# Altium project Pukk-Sensor-Module-v1.0.PrjPcb (part 3 of 6)

## Sheet Controller-Sheet-1.SchDoc
size 420 x 297 mm; SheetNumber: 3; SheetTotal: 8
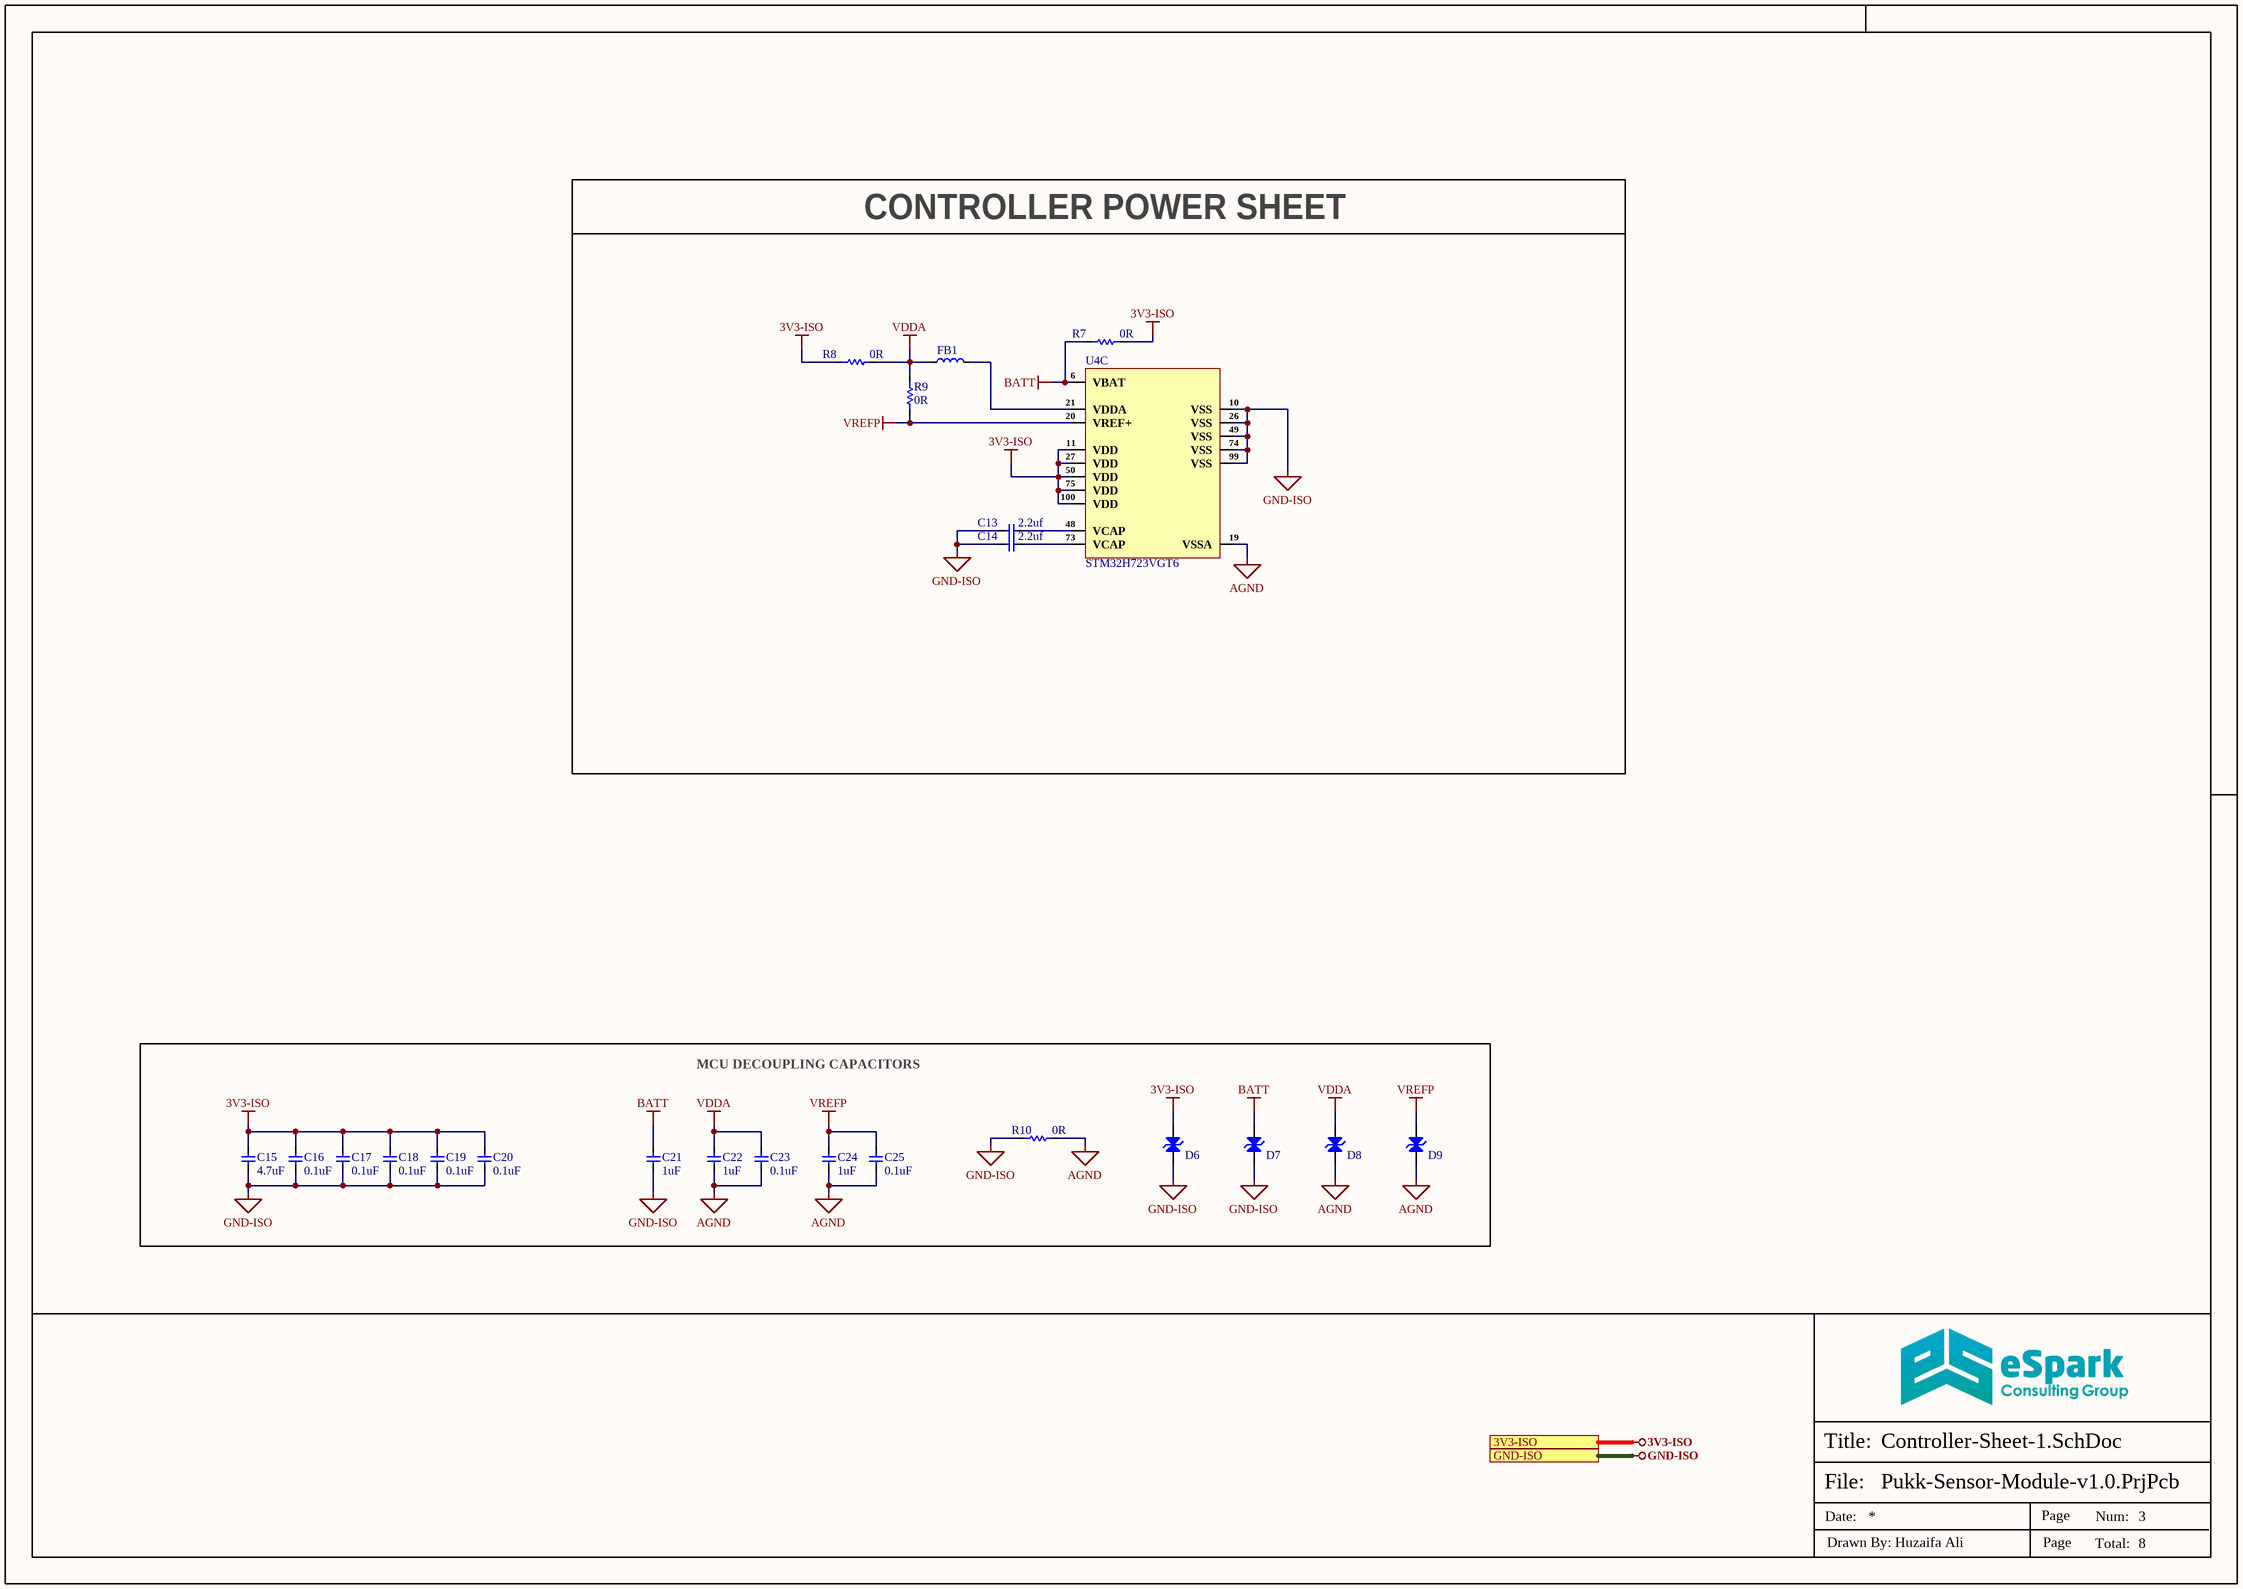
[diagram p2: Controller-Sheet-1.SchDoc]

### Parts
C13  2.2uf  [Cap-0402]
C14  2.2uf  [Cap-0402]
C15  4.7uF  [Cap-0402]
C16  0.1uF  [Cap-0402]
C17  0.1uF  [Cap-0402]
C18  0.1uF  [Cap-0402]
C19  0.1uF  [Cap-0402]
C20  0.1uF  [Cap-0402]
C21  1uF  [Cap-0402]
C22  1uF  [Cap-0402]
C23  0.1uF  [Cap-0402]
C24  1uF  [Cap-0402]
C25  0.1uF  [Cap-0402]
D6  ESDM2033MX4T5G  [DFN-2(0.3x0.6)]  (value not drawn)
D7  ESDM2033MX4T5G  [DFN-2(0.3x0.6)]  (value not drawn)
D8  ESDM2033MX4T5G  [DFN-2(0.3x0.6)]  (value not drawn)
D9  ESDM2033MX4T5G  [DFN-2(0.3x0.6)]  (value not drawn)
FB1  MMZ2012R102ATD25  [Ind-0805]  (value not drawn)
R7  0R  [Res-0402]
R8  0R  [Res-0402]
R9  0R  [Res-0402]
R10  0R  [Res-0402]
U4  STM32H723VGT6  [LQFP-100]  (part C of 3)

### Blocks framed on the sheet
CONTROLLER POWER SHEET: C13 C14 FB1 R7-R9 U4
MCU DECOUPLING CAPACITORS: C15-C25 D6-D9 R10

### Ports
3V3-ISO (see Top-Sheet[3A], CAN-Sheet[4D], Controller-Sheet-2[4D], Power-Sheet[4D], Sensors-Sheet[1D]), GND-ISO (see Top-Sheet[3A], CAN-Sheet[4D], Controller-Sheet-2[4D], Power-Sheet[4D], Sensors-Sheet[1D], USB-Sheet[4D])

### Nets
3V3-ISO: C15.2 C16.2 C17.2 C18.2 C19.2 C20.2 D6.2(A) R7.1 R8.2 U4.11(VDD) U4.27(VDD) U4.50(VDD) U4.75(VDD) U4.100(VDD) ; port 3V3-ISO
AGND: C22.1 C23.1 C24.1 C25.1 D8.1(A) D9.1(A) R10.2 U4.19(VSSA)
BATT: C21.2 D7.2(A) R7.2 U4.6(VBAT)
GND-ISO: C13.2 C14.2 C15.1 C16.1 C17.1 C18.1 C19.1 C20.1 C21.1 D6.1(A) D7.1(A) R10.1 U4.10(VSS) U4.26(VSS) U4.49(VSS) U4.74(VSS) U4.99(VSS) ; port GND-ISO
VDDA: C22.2 C23.2 D8.2(A) FB1.1 R8.1 R9.2
VREFP: C24.2 C25.2 D9.2(A) R9.1 U4.20(VREF+)
NetC13_1: C13.1 U4.48(VCAP)
NetC14_1: C14.1 U4.73(VCAP)
NetFB1_2: FB1.2 U4.21(VDDA)

### Notes on the sheet
- File:
- Title:
- Date:
- Page
- Num:
- Total:
- Drawn By: Huzaifa Ali

### Library data of the parts
C13 C14 = GRM155R61E225KE11D: CAP CER 2.2UF 25V X5R 0402; Manufacturer: Murata; Material: Ceramic; Tolerance: 10%; Item Type: Capacitor; Supplier 1: Avnet; Manufacturer Part Number: GRM155R61E225KE11D; RoHS: Yes; Category: Ceramic Capacitors; Stock 1: 210000; Pricing 1: 10000=0.03830, 20000=0.03623, 40000=0.03416, 60000=0.03209, 80000=0.03002, 100000=0.02795, 1000000=0.02588 (USD); Mount: Surface Mount; Case/Package: 0402; Case Code (Metric): 1005; Case Code (Imperial): 0402; Weight: 0.000212oz; Min Operating Temperature: -55°C; Max Operating Temperature: 85°C; Dielectric: X5R; Capacitance: 2.2uF; Packaging: Tape and Reel; Voltage Rating: 25V; Termination: SMD/SMT; Resistor Type: Ceramic; Voltage Rating (DC): 25V; Package Quantity: 10000; Length: 1mm; Width: 0.5mm; Height: 0.5mm; Thickness: 0.022inch; Lead Free: Lead Free; RoHS Compliant: Yes; ComponentLink1URL: http://www.mouser.com/ds/2/281/c02e-2905.pdf?src-supplier=Mouser; ComponentLink1Description: http://www.mouser.com/ds/2/281/c02e-2905.pdf?src-supplier=Mouser; ComponentLink2URL: http://search.murata.co.jp/Ceramy/image/img/A01X/G101/ENG/GRM155R61E225KE11-01.pdf?src-supplier=Digi-Key; ComponentLink2Description: http://search.murata.co.jp/Ceramy/image/img/A01X/G101/ENG/GRM155R61E225KE11-01.pdf?src-supplier=Digi-Key; ComponentLink3URL: http://search.murata.co.jp/Ceramy/image/img/A01X/partnumbering_e_01.pdf?src-supplier=Digi-Key; ComponentLink3Description: http://search.murata.co.jp/Ceramy/image/img/A01X/partnumbering_e_01.pdf?src-supplier=Digi-Key; ComponentLink4URL: http://psearch.en.murata.com/capacitor/product/GRM155R61E225KE11%23.pdf?src-supplier=Avnet; ComponentLink4Description: http://psearch.en.murata.com/capacitor/product/GRM155R61E225KE11%23.pdf?src-supplier=Avnet; Supplier Part Number 1: GRM155R61E225KE11D; LCSC Part Number: C385032
C15 = CC0402KRX5R6BB475: CAP CER 4.7UF 10V X5R 0402; Manufacturer: Yageo; Tolerance: 10%; Supplier 1: Farnell; Manufacturer Part Number: CC0402KRX5R6BB475; RoHS: Yes; Category: Ceramic Capacitors; Stock 1: 20000; Pricing 1: 10000=0.02310, 50000=0.02100 (GBP); Mount: Surface Mount; Case/Package: 0402; Case Code (Imperial): 0402; Case Code (Metric): 1005; Min Operating Temperature: -55°C; Max Operating Temperature: 85°C; Packaging: Cut Tape; Capacitance: 4.7uF; Voltage Rating: 10V; RoHS Compliant: Yes; ComponentLink1URL: http://www.yageo.com/documents/recent/UPY-GPHC_X5R_4V-to-50V_25.pdf?src-supplier=Digi-Key; ComponentLink1Description: http://www.yageo.com/documents/recent/UPY-GPHC_X5R_4V-to-50V_25.pdf?src-supplier=Digi-Key; Supplier Part Number 1: 3871698; LCSC Part Number: C326586
C16-C20 C23 C25 = CC0402JRX7R7BB104: CAP CER 0.1UF 16V X7R 0402; Manufacturer: Yageo; Material: 4241ConductorMaterial; Value: 100nF; Tolerance: 5%; Item Type: Capacitor; Supplier: Digikey; Supplier Part Number: 311-1676-1-ND; Manufacturer Part Number: CC0402JRX7R7BB104; RoHS: Yes; Category: Ceramic Capacitors; Stock: 1659111; Pricing: 1=0.1, 10=0.046, 50=0.0262, 100=0.0203, 500=0.01528, 1000=0.012, 2500=0.01091, 5000=0.01004 (USD); Mounting Technology: Surface Mount; Case/Package: 0402; Case Code (Metric): 1005; Case Code (Imperial): 0402; Min Operating Temperature: -55°C; Max Operating Temperature: 125°C; Dielectric: X7R; Packaging: Tape and Reel; Package Quantity: 10000; Voltage Rating (DC): 16V; Voltage Rating: 16V; Series: CC; Construction: Flat; Length: 0.039inch; Width: 0.02inch; Height: 0.5mm; Thickness: 0.022inch; Lead Free: Lead Free; Halogen Free: Halogen Free; RoHS Compliant: Yes; ComponentLink1URL: https://datasheet.ciiva.com/13210/upy-gphc-x7r-6-3v-to-50v-8-12304-13210152.pdf?src-supplier=Mouser; ComponentLink1Description: https://datasheet.ciiva.com/13210/upy-gphc-x7r-6-3v-to-50v-8-12304-13210152.pdf?src-supplier=Mouser; LCSC Part Number: C541464
C21 C22 C24 = CC0402KRX5R8BB105: CAP CER 1UF 25V X5R 0402; Manufacturer: Yageo; Tolerance: 10%; Supplier 1: Mouser; Manufacturer Part Number: CC0402KRX5R8BB105; RoHS: Yes; Category: Ceramic Capacitors; Stock 1: 91975; Pricing 1: 1=0.30000, 10=0.20400, 50=0.20400, 100=0.11600, 1000=0.07200, 10000=0.05900 (USD); Mount: Surface Mount; Case/Package: 0402; Case Code (Metric): 1005; Case Code (Imperial): 0402; Weight: 2.3E-05oz; Min Operating Temperature: -55°C; Max Operating Temperature: 85°C; Packaging: Tape and Reel; Capacitance: 1uF; Voltage Rating: 25V; Dielectric: X5R; Termination: SMD/SMT; Voltage Rating (DC): 25V; Package Quantity: 10000; Length: 0.039inch; Width: 0.02inch; Thickness: 0.022inch; Lead Free: Lead Free; Halogen Free: Halogen Free; RoHS Compliant: Yes; ComponentLink1URL: http://www.mouser.com/ds/2/447/Yageo_UPY-GP_NP0_16V-to-50V_9-358835.pdf?src-supplier=Mouser; ComponentLink1Description: http://www.mouser.com/ds/2/447/Yageo_UPY-GP_NP0_16V-to-50V_9-358835.pdf?src-supplier=Mouser; ComponentLink2URL: http://www.yageo.com/documents/recent/UPY-GPHC_X5R_4V-to-50V_25.pdf?src-supplier=Digi-Key; ComponentLink2Description: http://www.yageo.com/documents/recent/UPY-GPHC_X5R_4V-to-50V_25.pdf?src-supplier=Digi-Key; ComponentLink3URL: https://4donline.ihs.com/images/VipMasterIC/IC/YAGO/YAGO-S-A0006851646/YAGO-S-A0006851646-1.pdf?hkey=6D3A4C79FDBF58556ACFDE234799DDF0&src-supplier=Newark; ComponentLink3Description: https://4donline.ihs.com/images/VipMasterIC/IC/YAGO/YAGO-S-A0006851646/YAGO-S-A0006851646-1.pdf?hkey=6D3A4C79FDBF58556ACFDE234799DDF0&src-supplier=Newark; Supplier Part Number 1: 603-CC402KRX5R8BB105; LCSC Part Number: C326568
D6-D9 = ESDM2033MX4T5G: DIODE BIDIR ESD X4DFN2; Manufacturer: ON Semiconductor; Item Type: (TVS/ESD); Supplier: Avnet; LCSC Part Number: C896720; Manufacturer Part Number: ESDM2033MX4T5G; RoHS: Yes; Stock: 629400; Pricing: 8961=0.04129, 9000=0.04018, 18000=0.03906, 45000=0.03794, 90000=0.03683, 450000=0.03571, 900000=0.0346 (USD); Series: -
FB1 = MMZ2012R102ATD25: FERRITE BEAD 1K OHM 0805 1LN; Manufacturer: TDK; Number of Lines: 1; Max Current Rating: 500mA; DC Resistance (DCR): 300mR; Impedance: 1kR; Tolerance: 25%; Test Frequency: 100MHz; Supplier 1: Digi-Key; Manufacturer Part Number: MMZ2012R102ATD25; RoHS: Yes; Category: Ferrite Beads and Chips; Stock 1: 2942; Pricing 1: 1=0.11000, 10=0.09200, 25=0.08280, 50=0.06080, 100=0.05240, 250=0.04140, 500=0.03496, 1000=0.02944 (USD); Mount: Surface Mount; Case/Package: 0805; Case Code (Metric): 2012; Case Code (Imperial): 0805; Weight: 0.000194oz; Min Operating Temperature: -55°C; Max Operating Temperature: 125°C; Package Quantity: 4000; Packaging: Tape and Reel; Termination: SMD/SMT; Max DC Current: 500mA; Length: 0.079inch; Width: 0.049inch; Height: 0.041inch; Ratings: AEC-Q200; RoHS Compliant: Yes; ComponentLink1URL: http://www.mouser.com/ds/2/400/beads_automotive_signal_mmz_en-469244.pdf?src-supplier=Mouser; ComponentLink1Description: http://www.mouser.com/ds/2/400/beads_automotive_signal_mmz_en-469244.pdf?src-supplier=Mouser; ComponentLink2URL: https://product.tdk.com/info/en/catalog/datasheets/beads_automotive_signal_mmz2012_en.pdf?src-supplier=Digi-Key; ComponentLink2Description: https://product.tdk.com/info/en/catalog/datasheets/beads_automotive_signal_mmz2012_en.pdf?src-supplier=Digi-Key; Supplier Part Number 1: 445-MMZ2012R102ATD25CT-ND; LCSC Part Number: C307765; Item Type: Ferrite Bead
R7-R10 = RC0402FR-070RL: RES 0 OHM JUMPER 1/16W 0402; Manufacturer: Yageo; Item Type: Resistors; Tolerance: 1%; Power Rating: 62.5mW; Voltage Rating: 50V; Temperature Coefficient: 200ppm/°C; Max Power Dissipation: 63mW; Supplier 1: Mouser; Manufacturer Part Number: RC0402FR-070RL; RoHS: Yes; Stock 1: 8556842; Pricing 1: 1=0.10000, 10=0.01400, 50=0.01400, 100=0.00600, 1000=0.00300, 5000=0.00200, 10000=0.00100 (USD); Mount: Surface Mount; Case/Package: 0402; Contact Plating: Tin,Matte; Case Code (Imperial): 0402; Case Code (Metric): 1005; Size Code: 0402; Min Operating Temperature: -55°C; Max Operating Temperature: 155°C; Resistance: 0R; Resistor Type: Thick Film; Packaging: Tape and Reel; Termination: SMD/SMT; Features: Moisture Resistant; Series: RC; Number of Terminations: 2; Length: 1mm; Width: 0.5mm; Height: 0.35mm; Radiation Hardening: No; Lead Free: Lead Free; RoHS Compliant: Yes; ComponentLink1URL: https://datasheet.ciiva.com/8896/pyu-rc0402-51-rohs-l-6-8896149.pdf?src-supplier=Avnet; ComponentLink1Description: https://datasheet.ciiva.com/8896/pyu-rc0402-51-rohs-l-6-8896149.pdf?src-supplier=Avnet; ComponentLink2URL: https://datasheet.ciiva.com/16790/pyu-rc0402-51-rohs-l-6-r-16790444.pdf?src-supplier=Future+Electronics; ComponentLink2Description: https://datasheet.ciiva.com/16790/pyu-rc0402-51-rohs-l-6-r-16790444.pdf?src-supplier=Future+Electronics; Supplier Part Number 1: 603-RC0402FR-070RL; LCSC Part Number: C106231
U4 = STM32H723VGT6: IC MCU 32BIT 1MB FLASH 100LQFP; Manufacturer: STMicroelectronics; Item Type: Microcontrollers; Frequency: 550MHz; Max Supply Voltage: 3.6V; Nominal Supply Current: 4uA; Number of A/D Converters: 1; Number of Channels: 14; Number of I2C Channels: 5; Number of I/Os: 80; Number of Timers/Counters: 4; Number of UART Channels: 6; RAM Size: 564KB; Supplier: Arrow Electronics; LCSC Part Number: C730142; Manufacturer Part Number: STM32H723VGT6; RoHS: No; Stock: 102408; Pricing: 1=9.579, 10=8.258, 25=7.389, 100=7.316, 250=6.922, 540=6.641, 1080=6.564 (USD); Min Operating Temperature: -40°C; Max Operating Temperature: 85°C; Density: 1MB; Number of SPI Channels: 5

## Sheet Controller-Sheet-2.SchDoc
size 420 x 297 mm; SheetNumber: 4; SheetTotal: 8
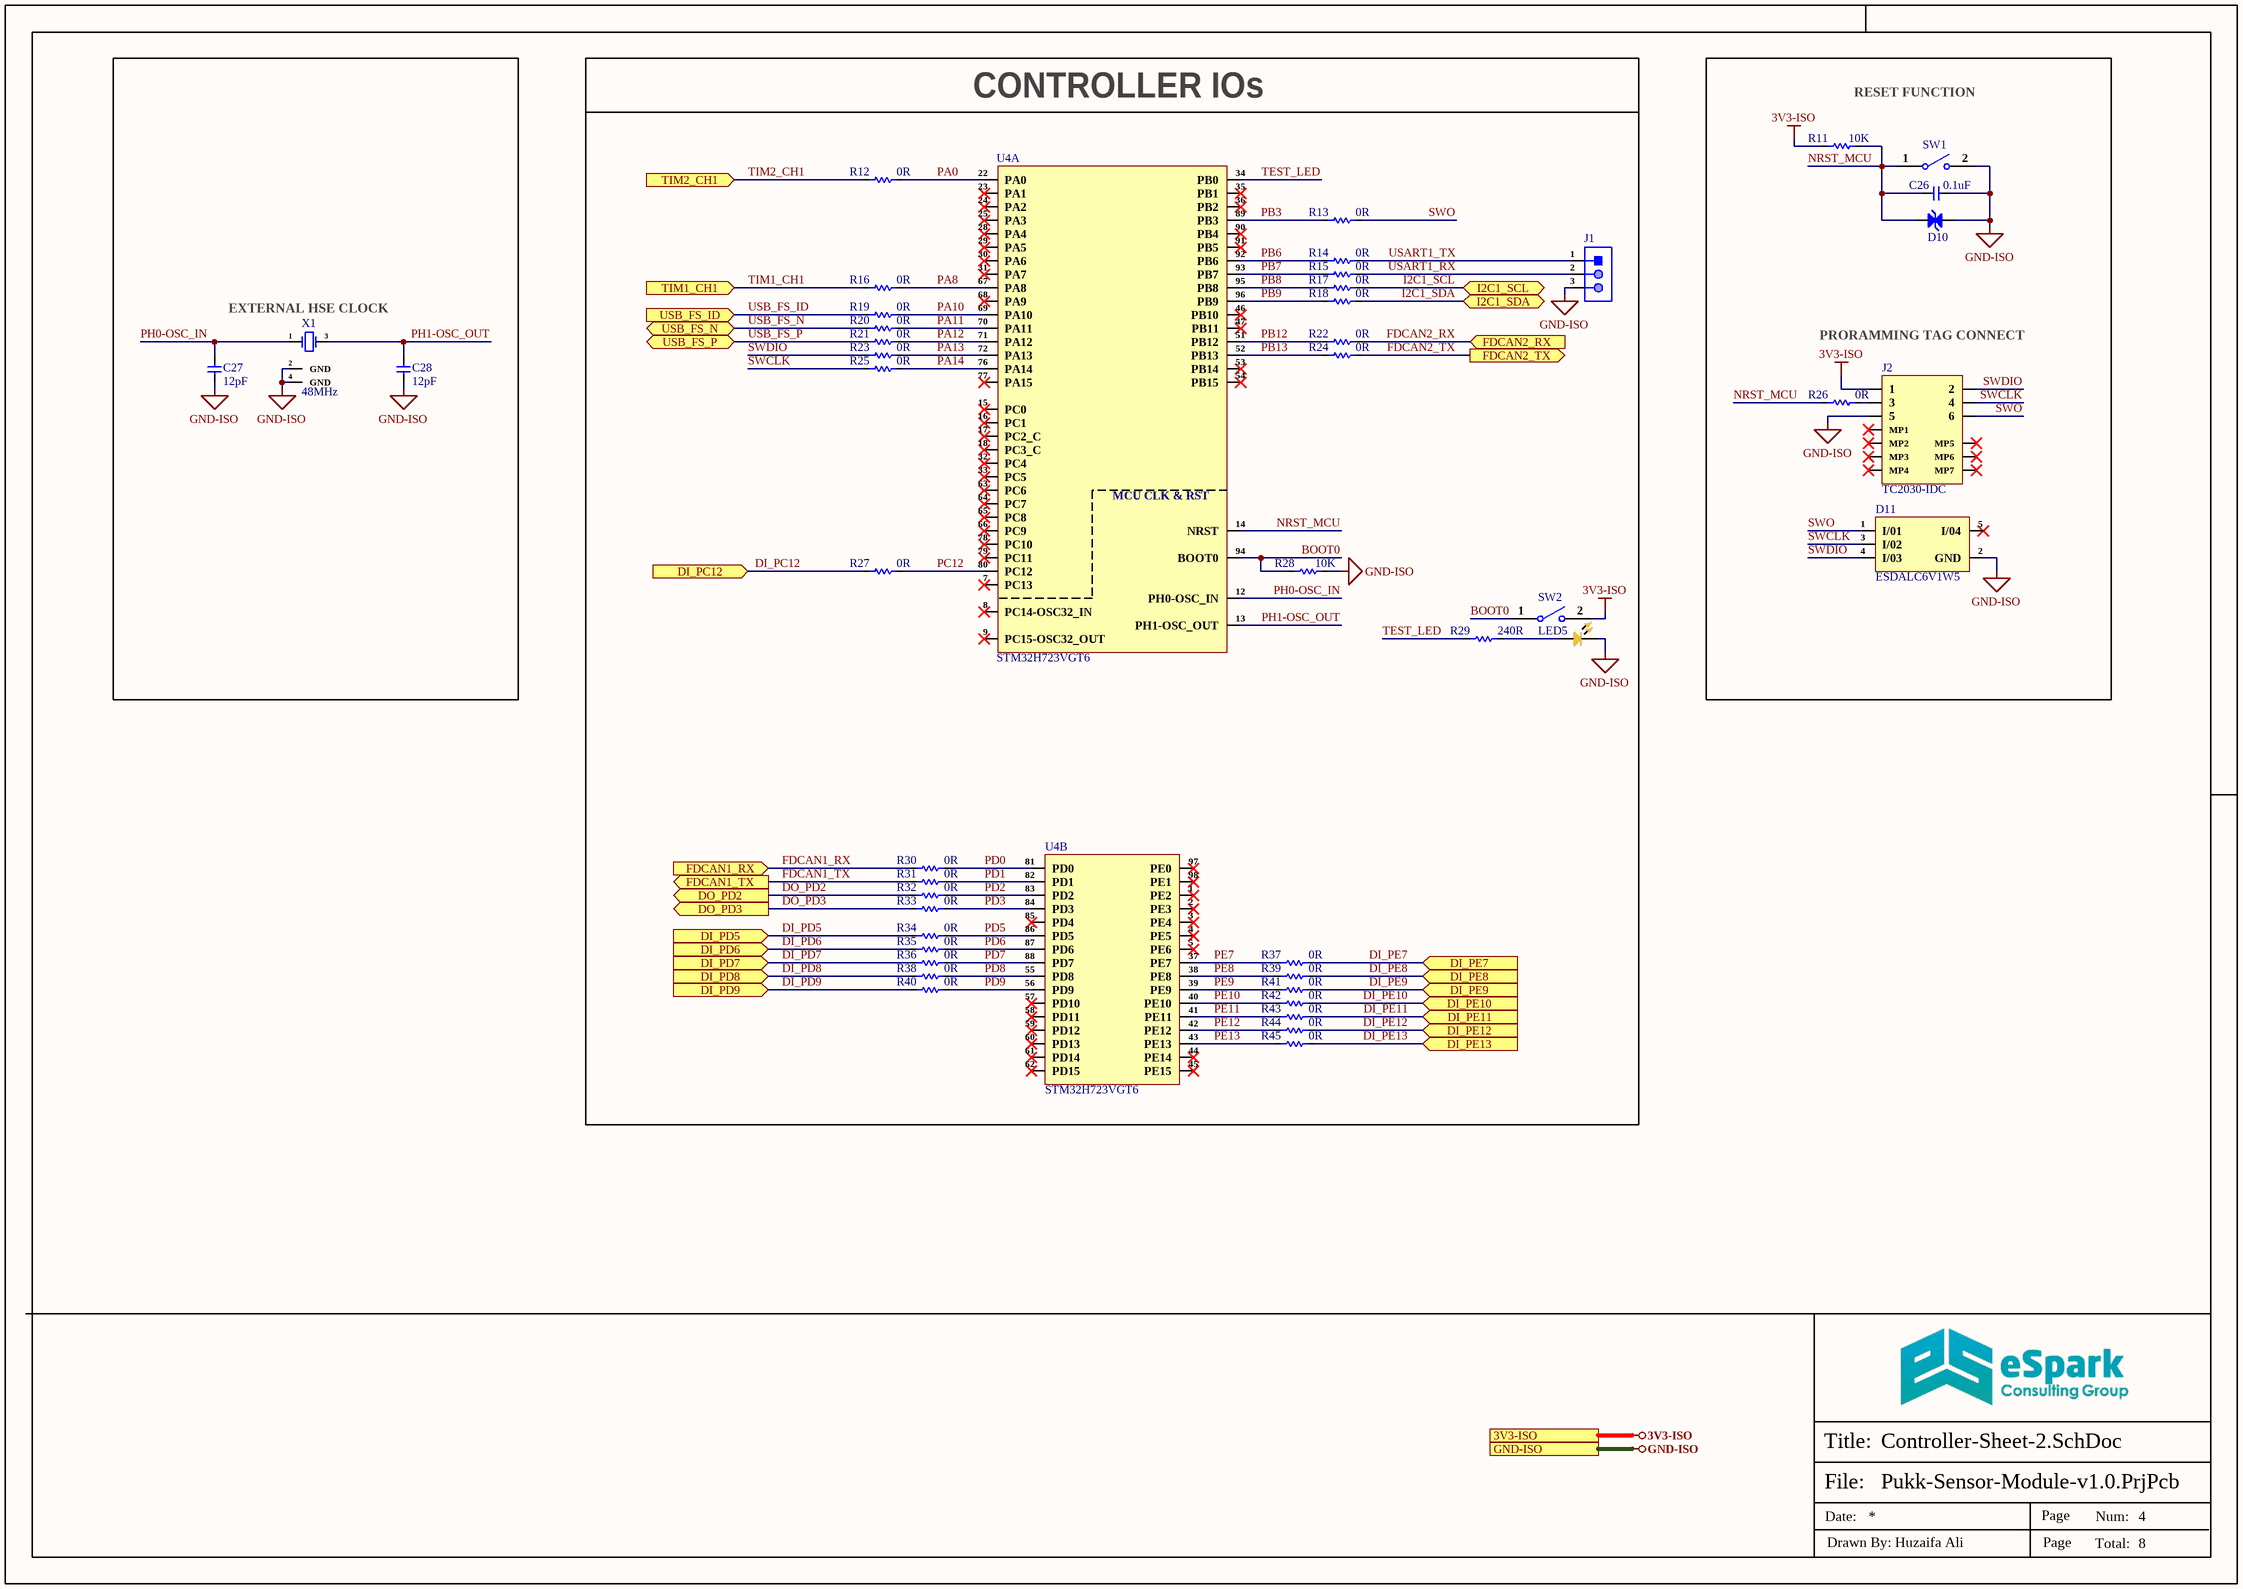
[diagram p3: Controller-Sheet-2.SchDoc]

### Parts
C26  0.1uF  [Cap-0402]
C27  12pF  [Cap-0402]
C28  12pF  [Cap-0402]
D10  ESDM2033MX4T5G  [DFN-2(0.3x0.6)]  (value not drawn)
D11  ESDALC6V1W5  [SOT-323-5]
J1  X6511WV-03H-C60D30  [HDR1X3_]  (value not drawn)
J2  TC2030-IDC  [TC2030-IDC_]
LED5  Yellow  [LED-0603]  (value not drawn)
R11  10K  [Res-0402]
R12  0R  [Res-0402]
R13  0R  [Res-0402]
R14  0R  [Res-0402]
R15  0R  [Res-0402]
R16  0R  [Res-0402]
R17  0R  [Res-0402]
R18  0R  [Res-0402]
R19  0R  [Res-0402]
R20  0R  [Res-0402]
R21  0R  [Res-0402]
R22  0R  [Res-0402]
R23  0R  [Res-0402]
R24  0R  [Res-0402]
R25  0R  [Res-0402]
R26  0R  [Res-0402]
R27  0R  [Res-0402]
R28  10K  [Res-0402]
R29  240R  [Res-0402]
R30  0R  [Res-0402]
R31  0R  [Res-0402]
R32  0R  [Res-0402]
R33  0R  [Res-0402]
R34  0R  [Res-0402]
R35  0R  [Res-0402]
R36  0R  [Res-0402]
R37  0R  [Res-0402]
R38  0R  [Res-0402]
R39  0R  [Res-0402]
R40  0R  [Res-0402]
R41  0R  [Res-0402]
R42  0R  [Res-0402]
R43  0R  [Res-0402]
R44  0R  [Res-0402]
R45  0R  [Res-0402]
SW1  B3U-1000P  [B3U-1000P]  (value not drawn)
SW2  B3U-1000P  [B3U-1000P]  (value not drawn)
U4  STM32H723VGT6  [LQFP-100]  (parts A,B of 3)
X1  48MHz  [SMD2016-4P]

### Blocks framed on the sheet
EXTERNAL HSE CLOCK: C27 C28 X1
CONTROLLER IOs: J1 LED5 R12-R25 R27-R45 SW2 U4

### Ports
3V3-ISO (see Top-Sheet[3A], CAN-Sheet[4D], Controller-Sheet-1[4D], Power-Sheet[4D], Sensors-Sheet[1D]), DI_PC12 (in, see Top-Sheet[3B]), DI_PD5 (in, see Top-Sheet[3B]), DI_PD6 (in, see Top-Sheet[3B]), DI_PD7 (in, see Top-Sheet[3B]), DI_PD8 (in, see Top-Sheet[3B]), DI_PD9 (in, see Top-Sheet[3B]), DI_PE7 (in, see Top-Sheet[3B]), DI_PE8 (in, see Top-Sheet[3B]), DI_PE9 (in, see Top-Sheet[3B]), DI_PE10 (in, see Top-Sheet[3B]), DI_PE11 (in, see Top-Sheet[3B]), DI_PE12 (in, see Top-Sheet[3B]), DI_PE13 (in, see Top-Sheet[3B]), DO_PD2 (out, see Top-Sheet[4A]), DO_PD3 (out, see Top-Sheet[4A]), FDCAN1_RX (in, see Top-Sheet[4A]), FDCAN1_TX (out, see Top-Sheet[4A]), FDCAN2_RX (in, see Top-Sheet[4B]), FDCAN2_TX (out, see Top-Sheet[4B]), GND-ISO (see Top-Sheet[3A], CAN-Sheet[4D], Controller-Sheet-1[4D], Power-Sheet[4D], Sensors-Sheet[1D], USB-Sheet[4D]), I2C1_SCL (bidir, see Top-Sheet[3B]), I2C1_SDA (bidir, see Top-Sheet[3B]), TIM1_CH1 (in, see Top-Sheet[3B]), TIM2_CH1 (in, see Top-Sheet[3B]), USB_FS_ID (in, see Top-Sheet[3A], USB-Sheet[1D]), USB_FS_N (bidir, see Top-Sheet[3A], USB-Sheet[1D]), USB_FS_P (bidir, see Top-Sheet[3A], USB-Sheet[1D])

### Nets
3V3-ISO: J2.1 R11.2 SW2.2 ; port 3V3-ISO
GND-ISO: C26.1 C27.1 C28.1 D10.1(A) D11.2(GND) J1.3 J2.5 LED5.2 R28.1 SW1.2 X1.2(GND) X1.4(GND) ; port GND-ISO
BOOT0: R28.2 SW2.1 U4.94(BOOT0)
DI_PC12: R27.2 ; port DI_PC12
DI_PD5: R34.2 ; port DI_PD5
DI_PD6: R35.2 ; port DI_PD6
DI_PD7: R36.2 ; port DI_PD7
DI_PD8: R38.2 ; port DI_PD8
DI_PD9: R40.2 ; port DI_PD9
DI_PE7: R37.1 ; port DI_PE7
DI_PE8: R39.1 ; port DI_PE8
DI_PE9: R41.1 ; port DI_PE9
DI_PE10: R42.1 ; port DI_PE10
DI_PE11: R43.1 ; port DI_PE11
DI_PE12: R44.1 ; port DI_PE12
DI_PE13: R45.1 ; port DI_PE13
DO_PD2: R32.2 ; port DO_PD2  [project net CAN1_STB]
DO_PD3: R33.2 ; port DO_PD3  [project net CAN1_SHDN]
FDCAN1_RX: R30.2 ; port FDCAN1_RX  [project net CAN1_RXD]
FDCAN1_TX: R31.2 ; port FDCAN1_TX  [project net CAN1_TXD]
FDCAN2_RX: R22.1 ; port FDCAN2_RX  [project net CAN2_RXD]
FDCAN2_TX: R24.1 ; port FDCAN2_TX  [project net CAN2_TXD]
I2C1_SCL: R17.1 ; port I2C1_SCL
I2C1_SDA: R18.1 ; port I2C1_SDA
NRST_MCU: C26.2 D10.2(A) R11.1 R26.2 SW1.1 U4.14(NRST)
PA0: R12.1 U4.22(PA0)
PA8: R16.1 U4.67(PA8)
PA10: R19.1 U4.69(PA10)
PA11: R20.1 U4.70(PA11)
PA12: R21.1 U4.71(PA12)
PA13: R23.1 U4.72(PA13)
PA14: R25.1 U4.76(PA14)
PB3: R13.2 U4.89(PB3)
PB6: R14.2 U4.92(PB6)
PB7: R15.2 U4.93(PB7)
PB8: R17.2 U4.95(PB8)
PB9: R18.2 U4.96(PB9)
PB12: R22.2 U4.51(PB12)
PB13: R24.2 U4.52(PB13)
PC12: R27.1 U4.80(PC12)
PD0: R30.1 U4.81(PD0)
PD1: R31.1 U4.82(PD1)
PD2: R32.1 U4.83(PD2)
PD3: R33.1 U4.84(PD3)
PD5: R34.1 U4.86(PD5)
PD6: R35.1 U4.87(PD6)
PD7: R36.1 U4.88(PD7)
PD8: R38.1 U4.55(PD8)
PD9: R40.1 U4.56(PD9)
PE7: R37.2 U4.37(PE7)
PE8: R39.2 U4.38(PE8)
PE9: R41.2 U4.39(PE9)
PE10: R42.2 U4.40(PE10)
PE11: R43.2 U4.41(PE11)
PE12: R44.2 U4.42(PE12)
PE13: R45.2 U4.43(PE13)
PH0-OSC_IN: C27.2 U4.12(PH0-OSC_IN) X1.1(OSC1)
PH1-OSC_OUT: C28.2 U4.13(PH1-OSC_OUT) X1.3(OSC2)
SWCLK: D11.3(I/02) J2.4 R25.2
SWDIO: D11.4(I/03) J2.2 R23.2
SWO: D11.1(I/01) J2.6 R13.1
TEST_LED: R29.1 U4.34(PB0)
TIM1_CH1: R16.2 ; port TIM1_CH1  [project net TACH_SIG]
TIM2_CH1: R12.2 ; port TIM2_CH1  [project net SPEED_SIG]
USART1_RX: J1.2 R15.1
USART1_TX: J1.1 R14.1
USB_FS_ID: R19.2 ; port USB_FS_ID
USB_FS_N: R20.2 ; port USB_FS_N
USB_FS_P: R21.2 ; port USB_FS_P
NetJ2_3: J2.3 R26.1
NetLED5_1: LED5.1 R29.2

Not connected (* = marked no-connect by the designer): D11 5(I/04)*; J2 MP1* MP2* MP3* MP4* MP5* MP6* MP7*; U4 1(PE2)* 2(PE3)* 3(PE4)* 4(PE5)* 5(PE6)* 7(PC13)* 8(PC14-OSC32_IN)* 9(PC15-OSC32_OUT)* 15(PC0)* 16(PC1)* 17(PC2_C)* 18(PC3_C)* 23(PA1)* 24(PA2)* 25(PA3)* 28(PA4)* 29(PA5)* 30(PA6)* 31(PA7)* 32(PC4)* 33(PC5)* 35(PB1)* 36(PB2)* 44(PE14)* 45(PE15)* 46(PB10)* 47(PB11)* 53(PB14)* 54(PB15)* 57(PD10)* 58(PD11)* 59(PD12)* 60(PD13)* 61(PD14)* 62(PD15)* 63(PC6)* 64(PC7)* 65(PC8)* 66(PC9)* 68(PA9)* 77(PA15)* 78(PC10)* 79(PC11)* 85(PD4)* 90(PB4)* 91(PB5)* 97(PE0)* 98(PE1)*

### Notes on the sheet
- RESET FUNCTION
- PRORAMMING TAG CONNECT
- File:
- Title:
- Date:
- Page
- Num:
- Total:
- Drawn By: Huzaifa Ali
- (in symbol STM32H723VGT6, part A) MCU CLK & RST

### Library data of the parts
C26 = CC0402JRX7R7BB104: as C16 on sheet Controller-Sheet-1; Supplier: Digikey; Supplier Part Number: 311-1676-1-ND; Manufacturer Part Number: CC0402JRX7R7BB104; RoHS: Yes; Category: Ceramic Capacitors; Stock: 1659111; Pricing: 1=0.1, 10=0.046, 50=0.0262, 100=0.0203, 500=0.01528, 1000=0.012, 2500=0.01091, 5000=0.01004 (USD); Mounting Technology: Surface Mount; Case/Package: 0402; Case Code (Metric): 1005; Case Code (Imperial): 0402; Min Operating Temperature: -55°C; Max Operating Temperature: 125°C; Dielectric: X7R; Packaging: Tape and Reel; Package Quantity: 10000; Voltage Rating (DC): 16V; Voltage Rating: 16V; Series: CC; Construction: Flat; Length: 0.039inch; Width: 0.02inch; Height: 0.5mm; Thickness: 0.022inch; Lead Free: Lead Free; Halogen Free: Halogen Free; RoHS Compliant: Yes; ComponentLink1URL: https://datasheet.ciiva.com/13210/upy-gphc-x7r-6-3v-to-50v-8-12304-13210152.pdf?src-supplier=Mouser; ComponentLink1Description: https://datasheet.ciiva.com/13210/upy-gphc-x7r-6-3v-to-50v-8-12304-13210152.pdf?src-supplier=Mouser; LCSC Part Number: C541464
C27 C28 = GJM1555C1H120GB01D: CAP CER 12PF 50V C0G/NP0 0402; Manufacturer: Murata; Tolerance: 2%; Dielectric: C0G; Supplier 1: Digi-Key; Manufacturer Part Number: GJM1555C1H120GB01D; RoHS: Yes; Category: Ceramic Capacitors; Stock 1: 266975; Pricing 1: 1=0.18000, 10=0.12600, 50=0.07560, 100=0.06390, 500=0.04370, 1000=0.03865, 2500=0.03698, 5000=0.03361 (USD); Mount: Surface Mount; Case/Package: 0402; Case Code (Imperial): 0402; Case Code (Metric): 1005; Min Operating Temperature: -55°C; Max Operating Temperature: 125°C; Capacitance: 12pF; Voltage Rating: 50V; Voltage Rating (DC): 50V; Packaging: Tape and Reel; Package Quantity: 10000; Termination: SMD/SMT; Series: GJM; Construction: Flat; Length: 1mm; Width: 0.5mm; Height: 0.5mm; Thickness: 0.022inch; Depth: 0.5mm; Radiation Hardening: No; Lead Free: Lead Free; RoHS Compliant: Yes; ComponentLink1URL: https://datasheet.ciiva.com/11608/product-11608208.pdf?src-supplier=Avnet; ComponentLink1Description: https://datasheet.ciiva.com/11608/product-11608208.pdf?src-supplier=Avnet; ComponentLink2URL: https://datasheet.ciiva.com/29542/partnumbering-e-01-29542716.pdf?src-supplier=Digi-Key; ComponentLink2Description: https://datasheet.ciiva.com/29542/partnumbering-e-01-29542716.pdf?src-supplier=Digi-Key; ComponentLink3URL: https://datasheet.ciiva.com/29542/partnumbering-e-01-29542715.pdf?src-supplier=Digi-Key; ComponentLink3Description: https://datasheet.ciiva.com/29542/partnumbering-e-01-29542715.pdf?src-supplier=Digi-Key; ComponentLink4URL: https://datasheet.ciiva.com/29542/partnumbering-e-01-29542717.pdf?src-supplier=Digi-Key; ComponentLink4Description: https://datasheet.ciiva.com/29542/partnumbering-e-01-29542717.pdf?src-supplier=Digi-Key; Supplier Part Number 1: 490-8078-1-ND; LCSC Part Number: C161305
D10 = ESDM2033MX4T5G: as D6 on sheet Controller-Sheet-1; Supplier: Avnet; LCSC Part Number: C896720; Manufacturer Part Number: ESDM2033MX4T5G; RoHS: Yes; Stock: 629400; Pricing: 8961=0.04129, 9000=0.04018, 18000=0.03906, 45000=0.03794, 90000=0.03683, 450000=0.03571, 900000=0.0346 (USD); Series: -
D11 = ESDALC6V1W5: TVS DIODE 3VWM SOT323-5; Manufacturer: STMicroelectronics; Item Type: TVS Diodes; Supplier: Future Electronics; LCSC Part Number: C703691; Manufacturer Part Number: ESDALC6V1W5; RoHS: Yes; Stock: 3000; Pricing: 3000=0.0569, 9000=0.0547, 12000=0.0774, 15000=0.0538, 30000=0.0749, 45000=0.0518, 75000=0.05 (USD); ComponentLink1URL: https://datasheet.ciiva.com/23847/cd00002946-23847220.pdf?src-supplier=Newark; ComponentLink1Description: https://datasheet.ciiva.com/23847/cd00002946-23847220.pdf?src-supplier=Newark; ComponentLink2URL: https://datasheet.ciiva.com/4509/cd00002946-81943-4509940.pdf?src-supplier=Mouser; ComponentLink2Description: https://datasheet.ciiva.com/4509/cd00002946-81943-4509940.pdf?src-supplier=Mouser; ComponentLink3URL: https://datasheet.ciiva.com/5782/cd00002946-5782886.pdf?src-supplier=Farnell; ComponentLink3Description: https://datasheet.ciiva.com/5782/cd00002946-5782886.pdf?src-supplier=Farnell; ComponentLink4URL: https://datasheet.ciiva.com/338/cd00002946-338376.pdf?src-supplier=Digikey; ComponentLink4Description: https://datasheet.ciiva.com/338/cd00002946-338376.pdf?src-supplier=Digikey; ComponentLink5URL: https://datasheet.ciiva.com/338/cd00002946-338377.pdf?src-supplier=Digikey; ComponentLink5Description: https://datasheet.ciiva.com/338/cd00002946-338377.pdf?src-supplier=Digikey; ComponentLink6URL: https://datasheet.ciiva.com/338/cd00002946-338378.pdf?src-supplier=Digikey; ComponentLink6Description: https://datasheet.ciiva.com/338/cd00002946-338378.pdf?src-supplier=Digikey
J1 = X6511WV-03H-C60D30: Gold 250V 3A Straight Square Pins 2.5mm 3P 260℃ 6mm -40℃~+105℃ 3mm 2.54mm Plugin Black Brass 1x3P Plugin,P=2.54mm Pin Headers ROHS; Manufacturer: XKB; Item Type: Male Header; Manufacturer Part Number: X6511WV-03H-C60D30; Package: Plugin,P=2.54mm; LCSC Part Number: C706875; ComponentLink1Description: LCSC; ComponentLink1URL: https://www.lcsc.com/product-detail/Pin-Headers_XKB-Connectivity-X6511WV-03H-C60D30_C706875.html
J2 = TC2030-IDC: CABLE ADAPTER 6 POS; Manufacturer: Tag-Connect; ComponentLink1URL: http://www.tag-connect.com/Materials/TC2030-MCP%20Datasheet.pdf?src-supplier=Digi-Key; ComponentLink1Description: http://www.tag-connect.com/Materials/TC2030-MCP%20Datasheet.pdf?src-supplier=Digi-Key; Supplier 1: Digi-Key; Manufacturer Part Number: TC2030-IDC; Stock 1: 284; Pricing 1: 1=43.71 (USD); Package Quantity: 1; Supplier Part Number 1: TC2030-IDC-ND
LED5 = NCD0603Y2: yellow 0603 Light Emitting Diodes (LED) ROHS; Manufacturer: Foshan NationStar Optoelectronics; Manufacturer Part Number: NCD0603Y2; Package: 0603; LCSC Part Number: C89811; Item Type: LED; ComponentLink1Description: LCSC; ComponentLink1URL: https://www.lcsc.com/product-detail/Light-Emitting-Diodes-LED_Foshan-NationStar-Optoelectronics-NCD0603Y2_C89811.html
R11 R28 = RC0402FR-0710KL: RES 10K OHM 1% 1/16W 0402; Manufacturer: Yageo; Resistance: 10kR; Voltage Rating (DC): 50V; Temperature Coefficient: 100ppm/°C; Power Rating: 62.5mW; Max Power Dissipation: 63mW; Item Type: Resistor; Supplier 1: Mouser; Manufacturer Part Number: RC0402FR-0710KL; RoHS: Yes; Category: Chip SMD Resistors; Stock 1: 18648329; Pricing 1: 1=0.10000, 10=0.01400, 50=0.01400, 100=0.00500, 1000=0.00300, 10000=0.00200 (USD); Case/Package: 0402; Number of Pins: 2; Case Code (Imperial): 0402; Case Code (Metric): 1005; Min Operating Temperature: -55°C; Max Operating Temperature: 155°C; Resistor Type: Thick Film; Tolerance: 1%; Packaging: Tape and Reel; Voltage Rating: 50V; Termination: SMD/SMT; Working Voltage: 50V; Number of Terminations: 2; Features: Moisture Resistant; Series: RC; Resistance Tolerance: 1%; Construction: Rectangular; Length: 1mm; Width: 0.5mm; Height: 0.32mm; Depth: 0.5mm; Lead Pitch: 0.2mm; REACH SVHC: No SVHC; Lead Free: Lead Free; RoHS Compliant: Yes; Military Standard: Not; ComponentLink1URL: https://datasheet.ciiva.com/7660/38568-7660787.pdf?src-supplier=Element14; ComponentLink1Description: https://datasheet.ciiva.com/7660/38568-7660787.pdf?src-supplier=Element14; ComponentLink2URL: https://datasheet.ciiva.com/7849/1686128-7849814.pdf?src-supplier=Element14; ComponentLink2Description: https://datasheet.ciiva.com/7849/1686128-7849814.pdf?src-supplier=Element14; ComponentLink3URL: https://datasheet.ciiva.com/7983/1018594-7983486.pdf?src-supplier=Element14; ComponentLink3Description: https://datasheet.ciiva.com/7983/1018594-7983486.pdf?src-supplier=Element14; ComponentLink4URL: https://datasheet.ciiva.com/22747/1018594-22747512.pdf?src-supplier=Element14; ComponentLink4Description: https://datasheet.ciiva.com/22747/1018594-22747512.pdf?src-supplier=Element14; ComponentLink5URL: https://datasheet.ciiva.com/12667/pyu-rc0402-51-rohs-l-6-r-12667067.pdf?src-supplier=Mouser; ComponentLink5Description: https://datasheet.ciiva.com/12667/pyu-rc0402-51-rohs-l-6-r-12667067.pdf?src-supplier=Mouser; ComponentLink6URL: https://datasheet.ciiva.com/7849/1784430-7849813.pdf?src-supplier=Element14; ComponentLink6Description: https://datasheet.ciiva.com/7849/1784430-7849813.pdf?src-supplier=Element14; ComponentLink7URL: https://datasheet.ciiva.com/7849/1784430-7849815.pdf?src-supplier=Element14; ComponentLink7Description: https://datasheet.ciiva.com/7849/1784430-7849815.pdf?src-supplier=Element14; Supplier Part Number 1: 603-RC0402FR-0710KL; LCSC Part Number: C60490
R12-R27 R30-R45 = RC0402FR-070RL: as R7 on sheet Controller-Sheet-1; Supplier 1: Mouser; Manufacturer Part Number: RC0402FR-070RL; RoHS: Yes; Stock 1: 8556842; Pricing 1: 1=0.10000, 10=0.01400, 50=0.01400, 100=0.00600, 1000=0.00300, 5000=0.00200, 10000=0.00100 (USD); Mount: Surface Mount; Case/Package: 0402; Contact Plating: Tin,Matte; Case Code (Imperial): 0402; Case Code (Metric): 1005; Size Code: 0402; Min Operating Temperature: -55°C; Max Operating Temperature: 155°C; Resistance: 0R; Resistor Type: Thick Film; Packaging: Tape and Reel; Termination: SMD/SMT; Features: Moisture Resistant; Series: RC; Number of Terminations: 2; Length: 1mm; Width: 0.5mm; Height: 0.35mm; Radiation Hardening: No; Lead Free: Lead Free; RoHS Compliant: Yes; ComponentLink1URL: https://datasheet.ciiva.com/8896/pyu-rc0402-51-rohs-l-6-8896149.pdf?src-supplier=Avnet; ComponentLink1Description: https://datasheet.ciiva.com/8896/pyu-rc0402-51-rohs-l-6-8896149.pdf?src-supplier=Avnet; ComponentLink2URL: https://datasheet.ciiva.com/16790/pyu-rc0402-51-rohs-l-6-r-16790444.pdf?src-supplier=Future+Electronics; ComponentLink2Description: https://datasheet.ciiva.com/16790/pyu-rc0402-51-rohs-l-6-r-16790444.pdf?src-supplier=Future+Electronics; Supplier Part Number 1: 603-RC0402FR-070RL; LCSC Part Number: C106231
R29 = RC0402FR-07240RL: RES 240 OHM 1% 1/16W 0402; Manufacturer: Yageo; Item Type: Resistors; Power Rating: 63mW; Temperature Coefficient: 100ppm/°C; Voltage Rating (DC): 50V; Supplier 1: Mouser; Manufacturer Part Number: RC0402FR-07240RL; RoHS: Yes; Stock 1: 1903202; Pricing 1: 1=0.10000, 10=0.01200, 50=0.01200, 100=0.00500, 1000=0.00300, 10000=0.00100 (USD); Case/Package: 0402; Case Code (Metric): 1005; Case Code (Imperial): 0402; Size Code: 0402; Min Operating Temperature: -55°C; Max Operating Temperature: 155°C; Resistance: 240R; Tolerance: 1%; Packaging: Tape and Reel; Resistor Type: Thick Film; Voltage Rating: 50V; Package Quantity: 1; Number of Terminations: 2; Termination: SMD/SMT; Max Power Dissipation: 63mW; Features: Moisture Resistant; Series: RC; Construction: Rectangular; Resistance Tolerance: 1%; Length: 1mm; Width: 0.02inch; Height: 0.016inch; Depth: 0.5mm; REACH SVHC: Unknown; Lead Free: Lead Free; RoHS Compliant: Yes; Military Standard: Not; ComponentLink1URL: https://datasheet.ciiva.com/7849/1018594-7849915.pdf?src-supplier=Element14; ComponentLink1Description: https://datasheet.ciiva.com/7849/1018594-7849915.pdf?src-supplier=Element14; ComponentLink2URL: https://datasheet.ciiva.com/7849/1018594-7849916.pdf?src-supplier=Element14; ComponentLink2Description: https://datasheet.ciiva.com/7849/1018594-7849916.pdf?src-supplier=Element14; ComponentLink3URL: https://datasheet.ciiva.com/2519/pyu-r-int-thick-7-2519157.pdf?src-supplier=Digi-Key; ComponentLink3Description: https://datasheet.ciiva.com/2519/pyu-r-int-thick-7-2519157.pdf?src-supplier=Digi-Key; ComponentLink4URL: https://datasheet.ciiva.com/2519/pyu-r-int-thick-7-2519158.pdf?src-supplier=Digi-Key; ComponentLink4Description: https://datasheet.ciiva.com/2519/pyu-r-int-thick-7-2519158.pdf?src-supplier=Digi-Key; ComponentLink5URL: https://datasheet.ciiva.com/2519/pyu-r-int-thick-7-2519156.pdf?src-supplier=Digi-Key; ComponentLink5Description: https://datasheet.ciiva.com/2519/pyu-r-int-thick-7-2519156.pdf?src-supplier=Digi-Key; ComponentLink6URL: https://datasheet.ciiva.com/12669/pyu-rc0402-51-rohs-l-6-r-12669689.pdf?src-supplier=Mouser; ComponentLink6Description: https://datasheet.ciiva.com/12669/pyu-rc0402-51-rohs-l-6-r-12669689.pdf?src-supplier=Mouser; ComponentLink7URL: https://datasheet.ciiva.com/17419/pyu-rc0402-51-rohs-l-6-r-17419482.pdf?src-supplier=Future+Electronics; ComponentLink7Description: https://datasheet.ciiva.com/17419/pyu-rc0402-51-rohs-l-6-r-17419482.pdf?src-supplier=Future+Electronics; Supplier Part Number 1: 603-RC0402FR-07240RL; LCSC Part Number: C114755
SW1 SW2 = B3U-1000P: SWITCH TACTILE SPST-NO 0.05A 12V; Manufacturer: Omron; Mechanical Life: 200000Cycles; Operating Force: 1.5N; Throw Configuration: SPST; Current Rating: 50mA; Contact Resistance: 100mR; Illumination Type: Non-Illuminated,Illuminated; Switch Travel: 0.15mm; Switch Function: Off-Mom; Actuator Type: Standard; Actuator Length: 0.4mm; Ratings: Dust Proof,IP40; ComponentLink1URL: http://www.farnell.com/datasheets/60838.pdf?src-supplier=Farnell; ComponentLink1Description: http://www.farnell.com/datasheets/60838.pdf?src-supplier=Farnell; ComponentLink2URL: http://www.farnell.com/datasheets/60838.pdf?src-supplier=Element14; ComponentLink2Description: http://www.farnell.com/datasheets/60838.pdf?src-supplier=Element14; ComponentLink3URL: https://omronfs.omron.com/en_US/ecb/products/pdf/en-b3u.pdf?src-supplier=Digi-Key; ComponentLink3Description: https://omronfs.omron.com/en_US/ecb/products/pdf/en-b3u.pdf?src-supplier=Digi-Key; ComponentLink4URL: http://www.omron.com/ecb/products/pdf/en-b3u.pdf?src-supplier=Digi-Key; ComponentLink4Description: http://www.omron.com/ecb/products/pdf/en-b3u.pdf?src-supplier=Digi-Key; ComponentLink5URL: https://www.distrelec.biz/Web/Downloads/he/et/B3U_eng_datasheet.pdf?mime=application%2Fpdf&src-supplier=Distrelec; ComponentLink5Description: https://www.distrelec.biz/Web/Downloads/he/et/B3U_eng_datasheet.pdf?mime=application%2Fpdf&src-supplier=Distrelec; ComponentLink6URL: http://www.onlinecomponents.com/productFiles/mf-OM/en-b3u.pdf?src-supplier=Onlinecomponents.com; ComponentLink6Description: http://www.onlinecomponents.com/productFiles/mf-OM/en-b3u.pdf?src-supplier=Onlinecomponents.com; Supplier 1: Digi-Key; Manufacturer Part Number: B3U-1000P; Stock 1: 116454; Pricing 1: 1=1, 10=0.961, 25=0.9064, 50=0.7976, 100=0.7251, 250=0.68888, 500=0.67074, 1000=0.52571 (USD); Mount: Surface Mount; Weight: 0.000776oz; Contact Material: Silver; Min Operating Temperature: -25°C; Max Operating Temperature: 70°C; Packaging: Tape and Reel; Voltage Rating (DC): 12V; Package Quantity: 1; Max Current Rating: 50mA; Termination: SMD/SMT; Orientation: Straight; Max Voltage Rating (DC): 12V; Electrical Life: 200000Cycles; Insulation Resistance: 100MR; Contact Current Rating: 50mA; Length: 4mm; Height: 1.2mm; Depth: 2.5mm; Width: 3mm; REACH SVHC: Unknown; Lead Free: Lead Free; ComponentLink7URL: https://www.verical.com/server-webapp/html/getDatasheet?partID=552554&src-supplier=Verical; ComponentLink7Description: https://www.verical.com/server-webapp/html/getDatasheet?partID=552554&src-supplier=Verical; ComponentLink8URL: http://www.farnell.com/datasheets/1685550.pdf?src-supplier=Element14; ComponentLink8Description: http://www.farnell.com/datasheets/1685550.pdf?src-supplier=Element14; ComponentLink9URL: http://www.farnell.com/datasheets/2610940.pdf?src-supplier=Farnell; ComponentLink9Description: http://www.farnell.com/datasheets/2610940.pdf?src-supplier=Farnell; ComponentLink10URL: https://www.alliedelec.com/m/d/4c8a9ef82804fc3c241a13c1e298fd73.pdf?src-supplier=Allied+Electronics; ComponentLink10Description: https://www.alliedelec.com/m/d/4c8a9ef82804fc3c241a13c1e298fd73.pdf?src-supplier=Allied+Electronics; Supplier Part Number 1: SW1020DKR-ND; LCSC Part Number: C231329; Item Type: Switch
U4 = STM32H723VGT6: as U4 on sheet Controller-Sheet-1; Supplier: Arrow Electronics; LCSC Part Number: C730142; Manufacturer Part Number: STM32H723VGT6; RoHS: No; Stock: 102408; Pricing: 1=9.579, 10=8.258, 25=7.389, 100=7.316, 250=6.922, 540=6.641, 1080=6.564 (USD); Min Operating Temperature: -40°C; Max Operating Temperature: 85°C; Density: 1MB; Number of SPI Channels: 5
X1 = Q22FA12800150: CRYSTAL 48.0000MHZ 10PF SMD; Manufacturer: Epson; Supplier: Farnell; LCSC Part Number: 2471841RL; Manufacturer Part Number: Q22FA12800150; Item Type: Crystal; Pricing: 500=0.24 (GBP)

## Sheet USB-Sheet.SchDoc
size 420 x 297 mm; SheetNumber: 5; SheetTotal: 8
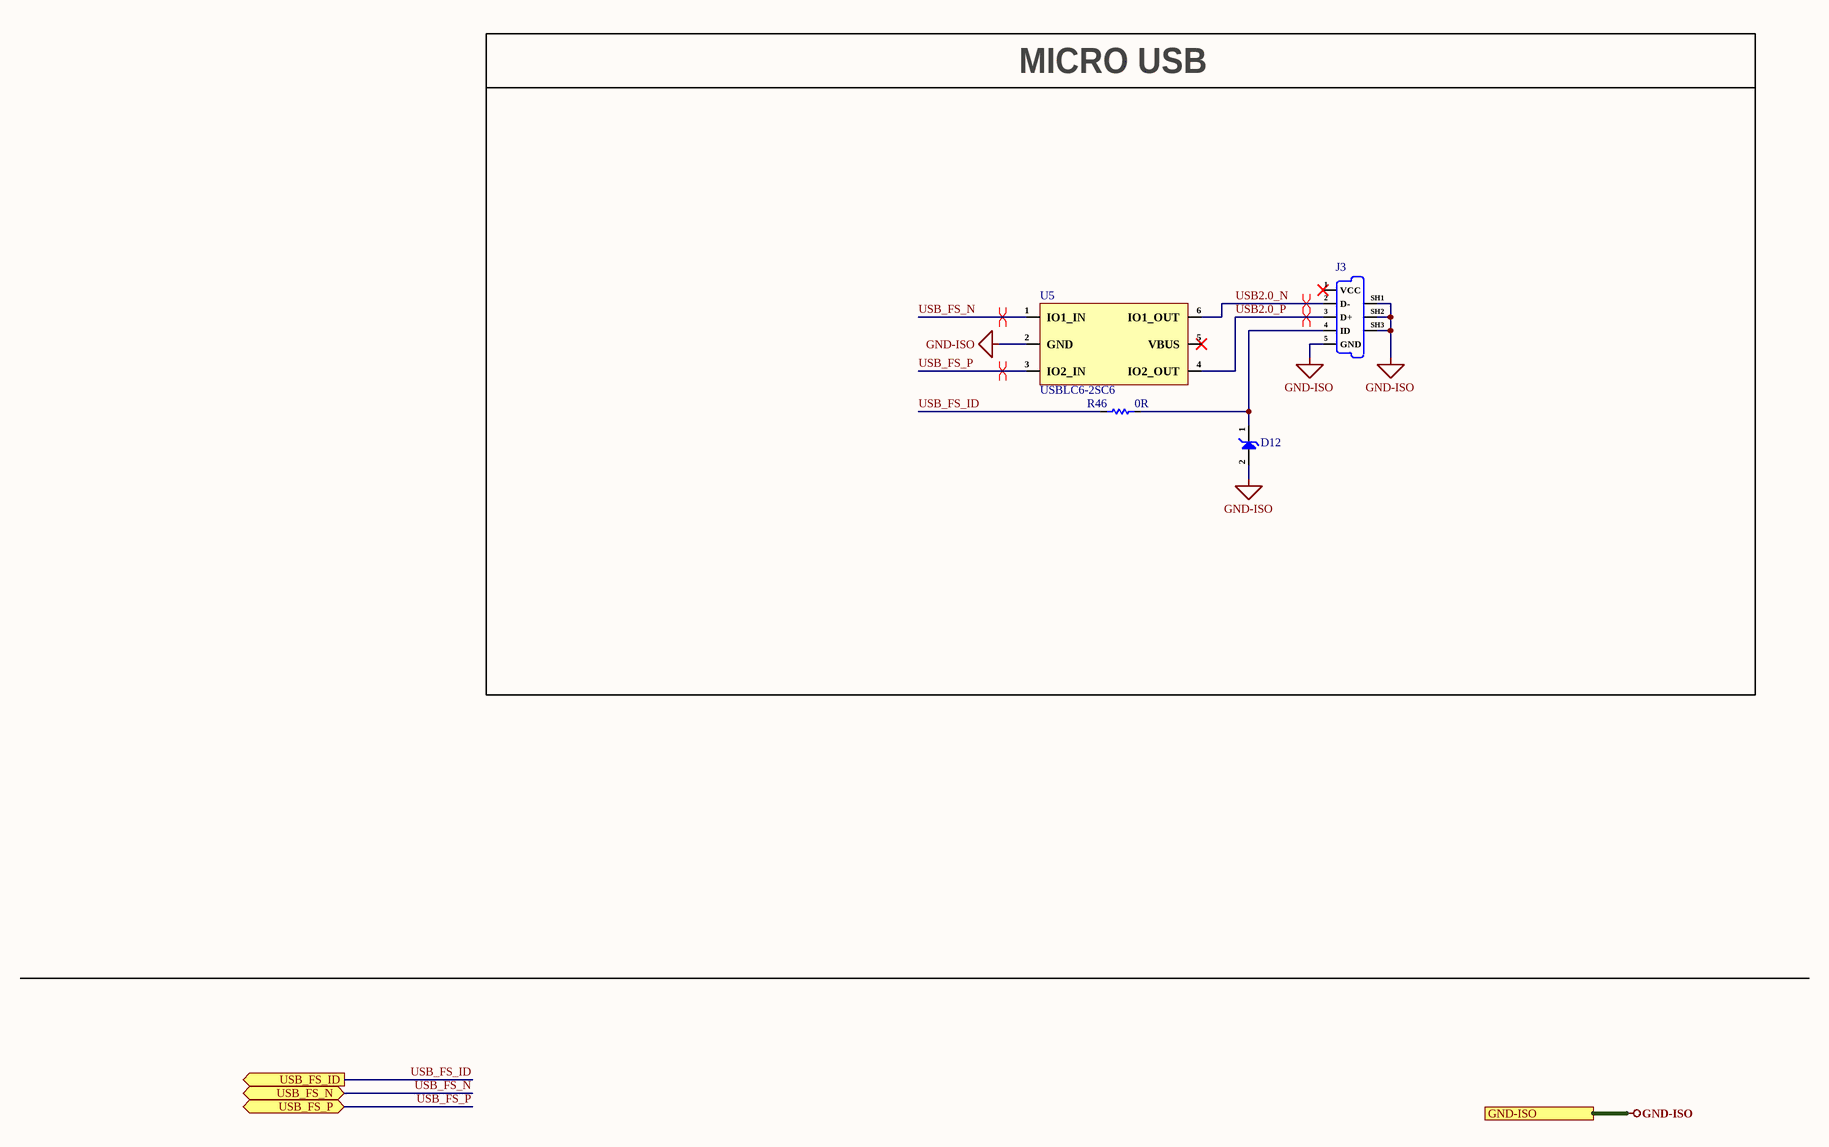
[diagram p4: USB-Sheet.SchDoc]

### Parts
D12  ESDALC6V1-1U2  [Diode-0201]  (value not drawn)
J3  U-E-051N-4BH21-S1B  [U-E-051N-4BH21-S1B]  (value not drawn)
R46  0R  [Res-0402]
U5  USBLC6-2SC6  [SOT-23-6]

### Blocks framed on the sheet
MICRO USB: D12 J3 R46 U5

### Ports
GND-ISO (see Top-Sheet[2A], CAN-Sheet[4D], Controller-Sheet-1[4D], Controller-Sheet-2[4D], Power-Sheet[4D], Sensors-Sheet[1D]), USB_FS_ID (out, see Top-Sheet[2A], Controller-Sheet-2[2A]), USB_FS_N (bidir, see Top-Sheet[2A], Controller-Sheet-2[2A]), USB_FS_P (bidir, see Top-Sheet[2A], Controller-Sheet-2[2A])

### Nets
GND-ISO: D12.2(A) J3.5(GND) J3.SH1(Sheild) J3.SH2(Sheild) J3.SH3(Sheild) U5.2(GND) ; port GND-ISO
USB2.0_N: J3.2(D-) U5.6(IO1_OUT)
USB2.0_P: J3.3(D+) U5.4(IO2_OUT)
USB_FS_ID: R46.1 ; port USB_FS_ID
USB_FS_N: U5.1(IO1_IN) ; port USB_FS_N
USB_FS_P: U5.3(IO2_IN) ; port USB_FS_P
NetD12_1: D12.1(K) J3.4(ID) R46.2

Not connected (* = marked no-connect by the designer): J3 1(VCC)*; U5 5(VBUS)*

### Layout directives
differential pair; differential pair class USB: USB2.0_N, USB2.0_P, USB_FS_N, USB_FS_P

### Notes on the sheet
- File:
- Title:
- Date:
- Page
- Num:
- Total:
- Drawn By: Huzaifa Ali

### Library data of the parts
D12 = ESDALC6V1-1U2: TVS DIODE 3VWM ST0201; Manufacturer: STMicroelectronics; Direction: Unidirectional; Value: 12pF; Number of Channels: 1; Reverse Breakdown Voltage: 6.1V; Reverse Standoff Voltage: 3V; Peak Pulse Power: 20W; Power Line Protection: No; Clamping Voltage: 12.2V; ESD Protection: Yes; Test Current: 1mA; Max Reverse Leakage Current: 100nA; Max Breakdown Voltage: 8V; Peak Pulse Current: 2A; Diode Type: ZENER; Supplier: Future Electronics; Supplier Part Number: 3110124; Manufacturer Part Number: ESDALC6V1-1U2; RoHS: Yes; Category: TVS Diodes; Stock: 405000; Pricing: 15000=0.0377, 45000=0.0364, 60000=0.0361, 150000=0.0351, 225000=0.0341 (USD); Mounting Technology: Surface Mount; Case/Package: 0201; Pins: 2; Case Code (Metric): 0603; Case Code (Imperial): 0201; Min Operating Temperature: -40°C; Max Operating Temperature: 125°C; Packaging: Tape and Reel; Number of Elements: 1; Number of Unidirectional Channels: 1; Min Breakdown Voltage: 6.1V; Breakdown Voltage: 6.1V; Polarity: Unidirectional; Termination: SMD/SMT; Leakage Current: 100nA; Max Power Dissipation: 20W; Power Dissipation: 20W; Series: ESDA, TRANSIL™; Length: 0.6mm; Width: 0.35mm; Height: 0.33mm; Depth: 0.3mm; Radiation Hardening: No; Reach SVHC Compliant: No; Lead Free: Lead Free; RoHS Compliant: Yes; ComponentLink1URL: https://datasheet.ciiva.com/1276/1684876-1276912.pdf?src-supplier=Element14; ComponentLink1Description: https://datasheet.ciiva.com/1276/1684876-1276912.pdf?src-supplier=Element14; ComponentLink2URL: https://datasheet.ciiva.com/4507/cd00212838-88488-4507763.pdf?src-supplier=Mouser; ComponentLink2Description: https://datasheet.ciiva.com/4507/cd00212838-88488-4507763.pdf?src-supplier=Mouser; ComponentLink3URL: https://datasheet.ciiva.com/16205/cd00212838-16205762.pdf?src-supplier=Future+Electronics; ComponentLink3Description: https://datasheet.ciiva.com/16205/cd00212838-16205762.pdf?src-supplier=Future+Electronics; ComponentLink4URL: https://datasheet.ciiva.com/15143/getdatasheetpartid-185245-15143908.pdf?src-supplier=Verical; ComponentLink4Description: https://datasheet.ciiva.com/15143/getdatasheetpartid-185245-15143908.pdf?src-supplier=Verical; ComponentLink5URL: https://datasheet.ciiva.com/22695/1684876-22695674.pdf?src-supplier=Element14; ComponentLink5Description: https://datasheet.ciiva.com/22695/1684876-22695674.pdf?src-supplier=Element14; ComponentLink6URL: https://datasheet.ciiva.com/337/cd00212838-337652.pdf?src-supplier=Digikey; ComponentLink6Description: https://datasheet.ciiva.com/337/cd00212838-337652.pdf?src-supplier=Digikey; ComponentLink7URL: https://datasheet.ciiva.com/337/cd00212838-337651.pdf?src-supplier=Digikey; ComponentLink7Description: https://datasheet.ciiva.com/337/cd00212838-337651.pdf?src-supplier=Digikey; ComponentLink8URL: https://datasheet.ciiva.com/337/cd00212838-337653.pdf?src-supplier=Digikey; ComponentLink8Description: https://datasheet.ciiva.com/337/cd00212838-337653.pdf?src-supplier=Digikey; ComponentLink9URL: https://datasheet.ciiva.com/11193/cd00212838-11193350.pdf?src-supplier=Avnet; ComponentLink9Description: https://datasheet.ciiva.com/11193/cd00212838-11193350.pdf?src-supplier=Avnet; ComponentLink10URL: https://datasheet.ciiva.com/41443/001184301-da-01-en-transil-sgl-un-esdalc6v1-1u2-st-0201-stm-41443159.pdf?src-supplier=Conrad; ComponentLink10Description: https://datasheet.ciiva.com/41443/001184301-da-01-en-transil-sgl-un-esdalc6v1-1u2-st-0201-stm-41443159.pdf?src-supplier=Conrad
J3 = U-E-051N-4BH21-S1B: 3A 1 5P Mother -40℃~+85℃ Micro-B SMD USB Connectors ROHS; Manufacturer: XKB Connection; Manufacturer Part Number: U-E-051N-4BH21-S1B; Package: SMD; LCSC Part Number: C319153; Item Type: USB Connectors; ComponentLink1Description: LCSC; ComponentLink1URL: https://www.lcsc.com/product-detail/USB-Connectors_XKB-Connection-U-E-051N-4BH21-S1B_C319153.html
R46 = RC0402FR-070RL: as R7 on sheet Controller-Sheet-1; Supplier 1: Mouser; Manufacturer Part Number: RC0402FR-070RL; RoHS: Yes; Stock 1: 8556842; Pricing 1: 1=0.10000, 10=0.01400, 50=0.01400, 100=0.00600, 1000=0.00300, 5000=0.00200, 10000=0.00100 (USD); Mount: Surface Mount; Case/Package: 0402; Contact Plating: Tin,Matte; Case Code (Imperial): 0402; Case Code (Metric): 1005; Size Code: 0402; Min Operating Temperature: -55°C; Max Operating Temperature: 155°C; Resistance: 0R; Resistor Type: Thick Film; Packaging: Tape and Reel; Termination: SMD/SMT; Features: Moisture Resistant; Series: RC; Number of Terminations: 2; Length: 1mm; Width: 0.5mm; Height: 0.35mm; Radiation Hardening: No; Lead Free: Lead Free; RoHS Compliant: Yes; ComponentLink1URL: https://datasheet.ciiva.com/8896/pyu-rc0402-51-rohs-l-6-8896149.pdf?src-supplier=Avnet; ComponentLink1Description: https://datasheet.ciiva.com/8896/pyu-rc0402-51-rohs-l-6-8896149.pdf?src-supplier=Avnet; ComponentLink2URL: https://datasheet.ciiva.com/16790/pyu-rc0402-51-rohs-l-6-r-16790444.pdf?src-supplier=Future+Electronics; ComponentLink2Description: https://datasheet.ciiva.com/16790/pyu-rc0402-51-rohs-l-6-r-16790444.pdf?src-supplier=Future+Electronics; Supplier Part Number 1: 603-RC0402FR-070RL; LCSC Part Number: C106231
U5 = USBLC6-2SC6: 6A 12V 150W 6V Unidirectional 5V SOT-23-6 ESD and Surge Protection (TVS/ESD) ROHS; Manufacturer: TECH PUBLIC; Manufacturer Part Number: USBLC6-2SC6; Package: SOT-23-6; LCSC Part Number: C2827654; Item Type: (TVS/ESD); ComponentLink1Description: LCSC; ComponentLink1URL: https://www.lcsc.com/product-detail/ESD-and-Surge-Protection-TVS-ESD_TECH-PUBLIC-USBLC6-2SC6_C2827654.html